# Altium schematic sheet MCU_IO.SchDoc: MCU - Peripheral and Pin Assignment
size A2; ApprovedBy: Weymen Koo; CheckedBy: -; DrawnBy: Weymen Koo; DocumentNumber: UBCAD-FCSOM-SCH; Revision: A; SheetNumber: 3; SheetTotal: 18; ProjectTitle: Flight Controller SoM; Status: PRELIMINARY; ReleaseDate: 2026-11-14
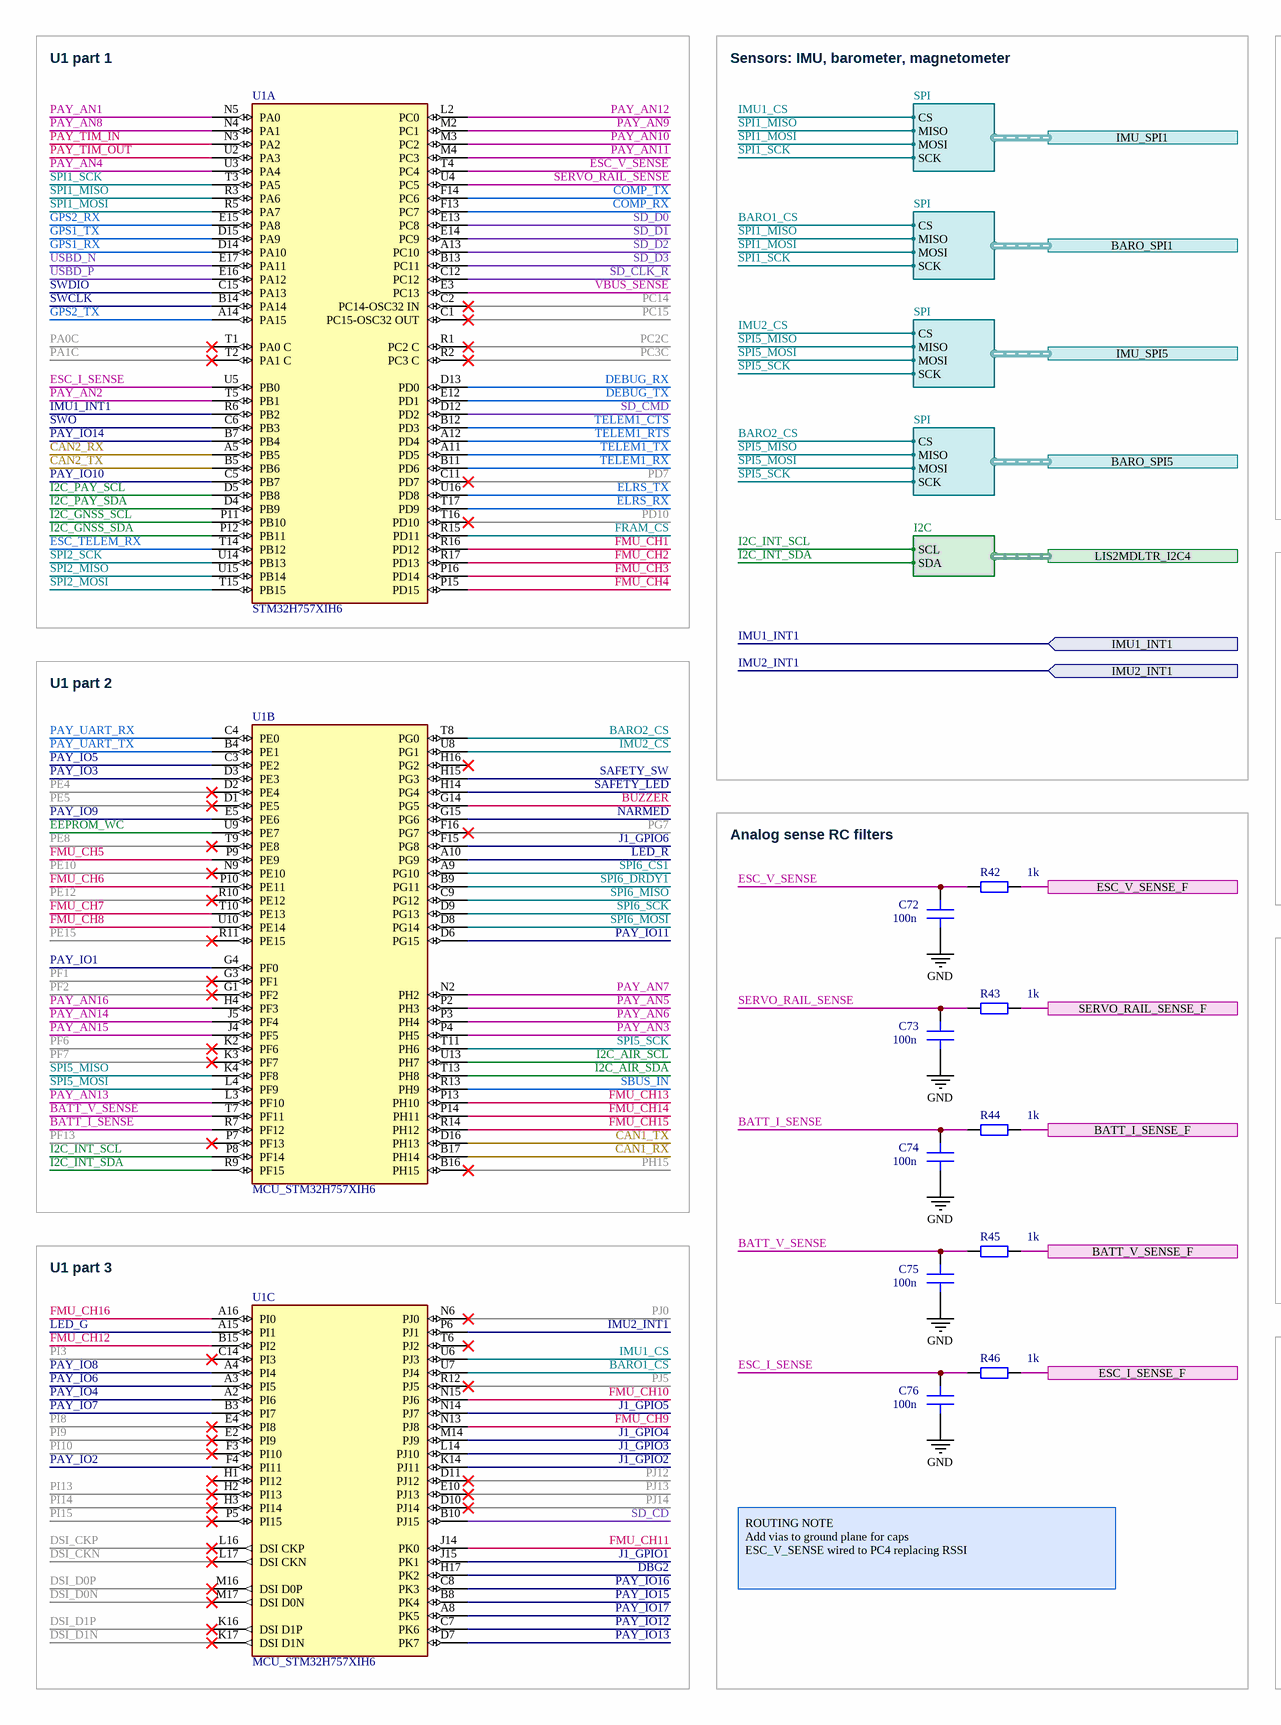
[diagram p0: MCU_IO.SchDoc, left]
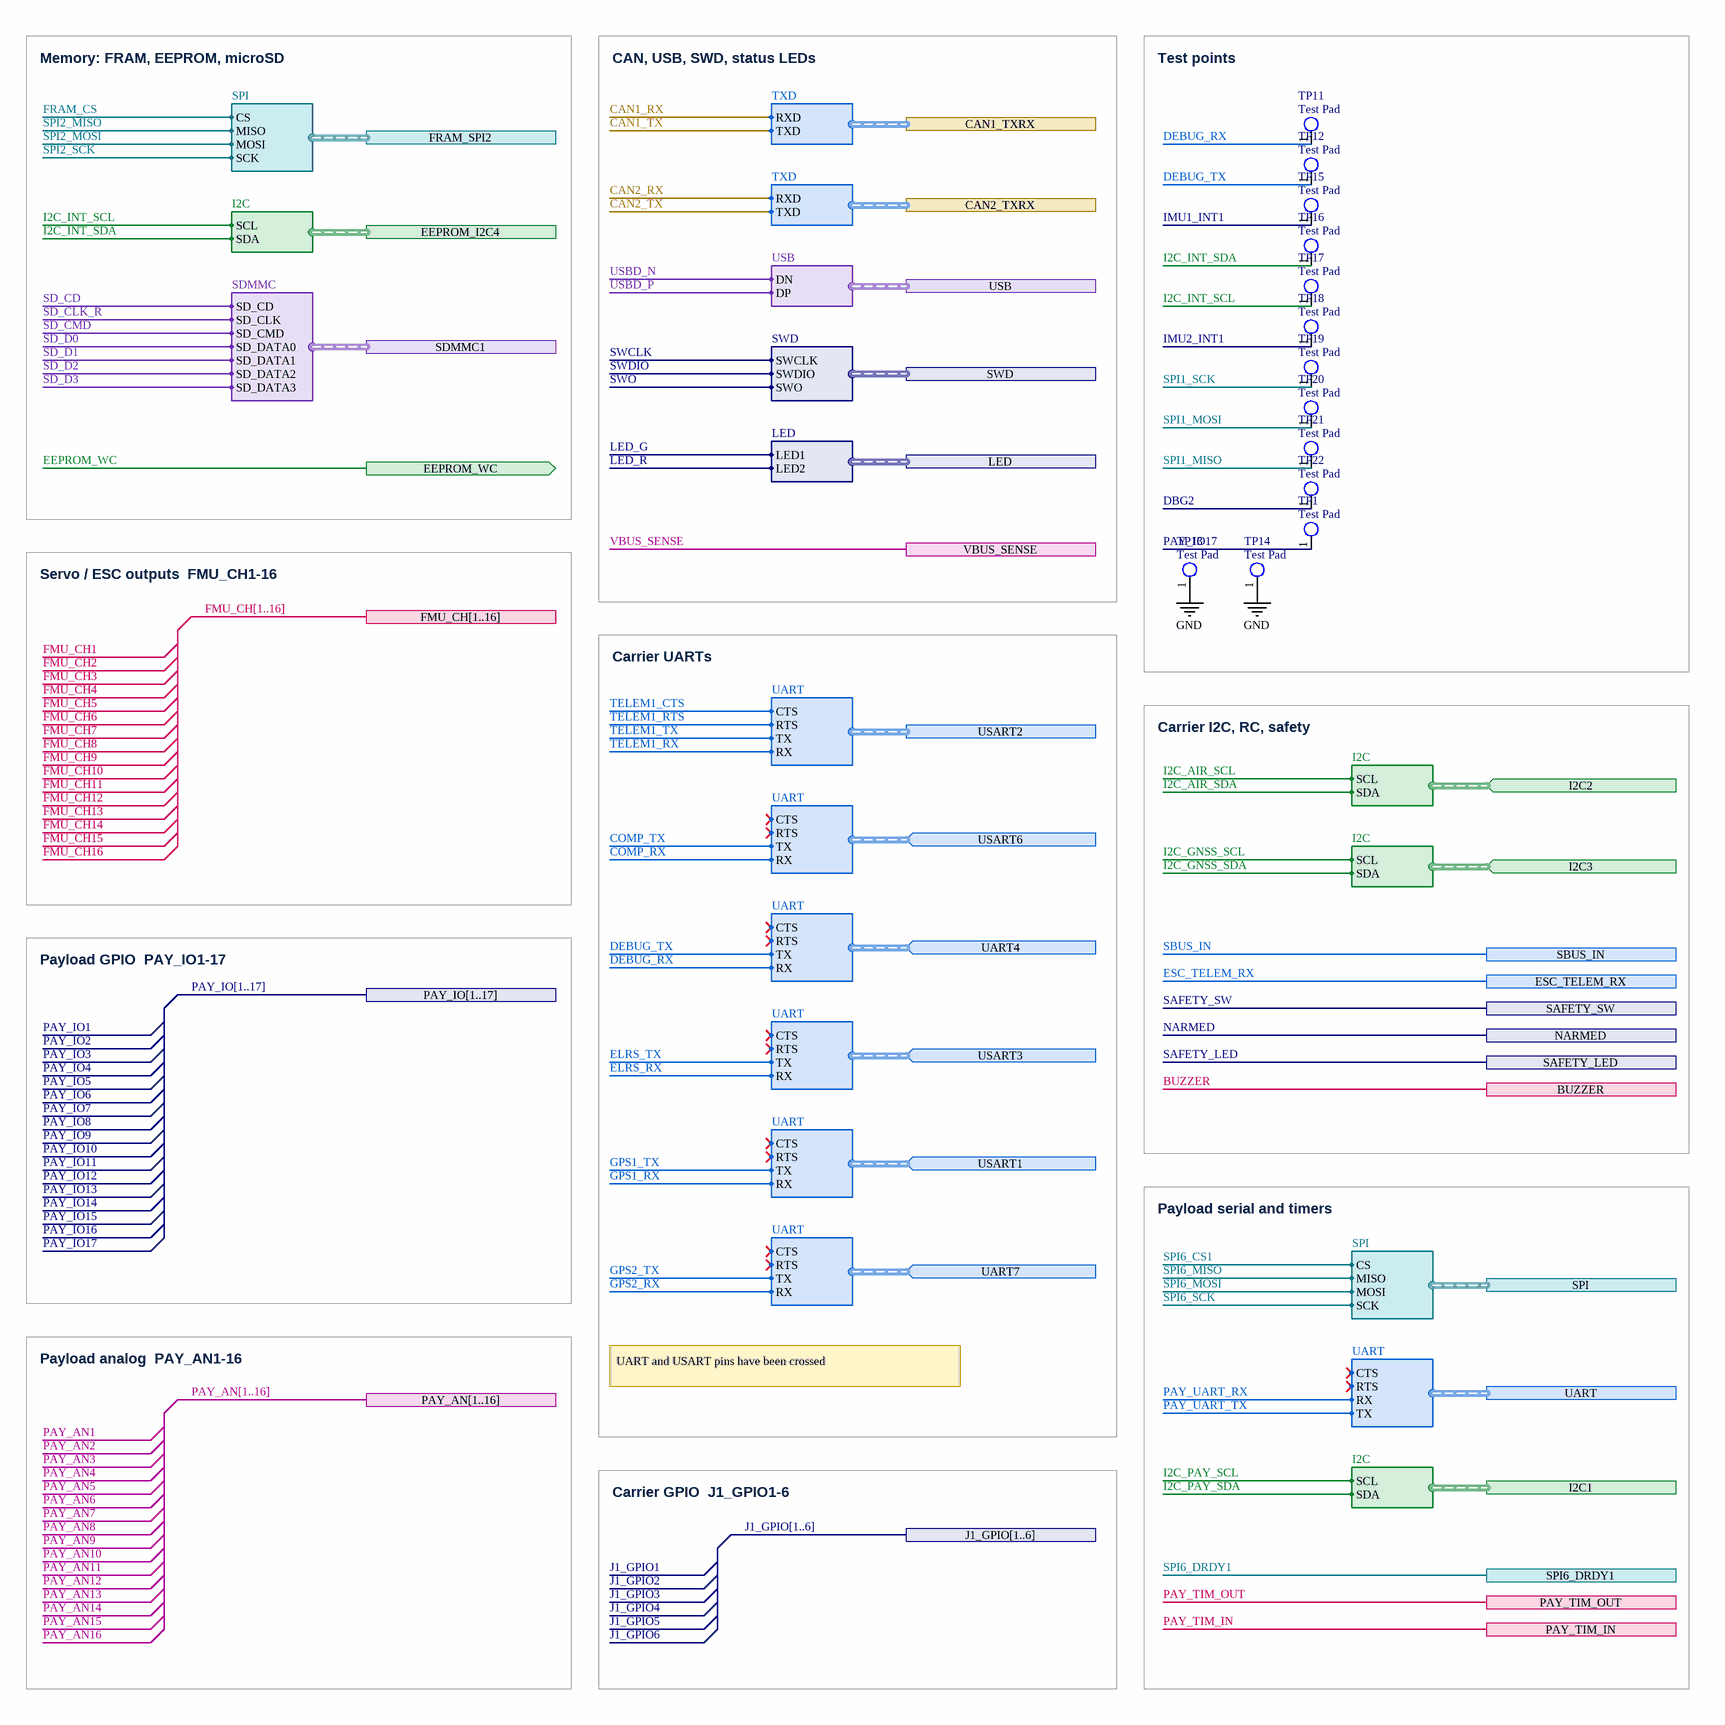
[diagram p1: MCU_IO.SchDoc, right]

## Parts
C72  100n  [IPC C C0402 NO SILK]
C73  100n  [IPC C C0402 NO SILK]
C74  100n  [IPC C C0402 NO SILK]
C75  100n  [IPC C C0402 NO SILK]
C76  100n  [IPC C C0402 NO SILK]
R42  1k  [IPC C R0402 NO SILK]
R43  1k  [IPC C R0402 NO SILK]
R44  1k  [IPC C R0402 NO SILK]
R45  1k  [IPC C R0402 NO SILK]
R46  1k  [IPC C R0402 NO SILK]
TP1  Test Pad  [PCBComponent_1]
TP11  Test Pad  [PCBComponent_1]
TP12  Test Pad  [PCBComponent_1]
TP13  Test Pad  [PCBComponent_1]
TP14  Test Pad  [PCBComponent_1]
TP15  Test Pad  [PCBComponent_1]
TP16  Test Pad  [PCBComponent_1]
TP17  Test Pad  [PCBComponent_1]
TP18  Test Pad  [PCBComponent_1]
TP19  Test Pad  [PCBComponent_1]
TP20  Test Pad  [PCBComponent_1]
TP21  Test Pad  [PCBComponent_1]
TP22  Test Pad  [PCBComponent_1]
U1  STM32H757XIH6  [FP-TFBGA2650-A07U-MFG]  (parts A,B,C of 5)

## Blocks framed on the sheet
U1 part 1: U1
Test points: TP1 TP11-TP22
U1 part 2: U1
Analog sense RC filters: C72-C76 R42-R46
U1 part 3: U1

## Ports
BARO_SPI1 (harness SPI, see 1[5B], 5[6B]), BARO_SPI5 (harness SPI, see 1[5B], 8[6B]), BATT_I_SENSE_F (see 1[4C], 18[2C]), BATT_V_SENSE_F (see 1[4C], 18[2C]), BUZZER (see 1[4D], 18[5A]), CAN1_TXRX (harness TXD, see 1[4C], 13[2B]), CAN2_TXRX (harness TXD, see 1[5A], 14[2B]), EEPROM_I2C4 (harness I2C, see 1[4B], 12[7B]), EEPROM_WC (out, see 1[4B], 12[2B]), ESC_I_SENSE_F (see 1[4C], 18[2C]), ESC_TELEM_RX (see 1[4D], 18[2D]), ESC_V_SENSE_F (see 1[4C], 18[2C]), FMU_CH[1..16] (see 1[4C], 18[5B]), FRAM_SPI2 (harness SPI, see 1[4B], 10[6C]), I2C1 (harness I2C, see 1[5C], 17[5C]), I2C2 (in, harness I2C, see 1[4C], 18[5D]), I2C3 (in, harness I2C, see 1[4C], 18[5C]), IMU1_INT1 (in, see 1[5A], 6[6B]), IMU2_INT1 (in, see 1[5B], 9[7C]), IMU_SPI1 (harness SPI, see 1[5A], 6[7B]), IMU_SPI5 (harness SPI, see 1[5B], 9[7B]), J1_GPIO[1..6] (see 1[4C], 18[5C]), LED (harness LED, see 1[5D], 15[5B]), LIS2MDLTR_I2C4 (harness I2C, see 1[5B], 7[6B]), NARMED (see 1[4D], 18[5A]), PAY_AN[1..16] (see 1[5C], 17[2C]), PAY_IO[1..17] (see 1[5C], 17[5A]), PAY_TIM_IN (see 1[5C], 17[5C]), PAY_TIM_OUT (see 1[5C], 17[5C]), SAFETY_LED (see 1[4D], 18[5A]), SAFETY_SW (see 1[4D], 18[5A]), SBUS_IN (see 1[4D], 18[2D]), SDMMC1 (harness SDMMC, see 1[4B], 11[7B]), SERVO_RAIL_SENSE_F (see 1[4D], 18[2C]), SPI6_DRDY1 (see 1[5C], 17[7C]), SPI (harness SPI, see 1[5C], 17[7B]), SWD (harness SWD, see 1[4A], 16[6C]), UART4 (in, harness UART, see 1[4C], 18[7B]), UART7 (in, harness UART, see 1[4C], 18[7B]), UART (harness UART, see 1[5C], 17[7A]), USART1 (in, harness UART, see 1[4C], 18[7B]), USART2 (harness UART, see 1[4C], 18[7C]), USART3 (in, harness UART, see 1[4C], 18[7A]), USART6 (in, harness UART, see 1[4C], 18[7A]), USB (harness USB, see 1[4A], 16[6B]), VBUS_SENSE (see 1[4B], 16[6A])

## Harnesses
TXD: RXD, TXD
SPI: CS, MISO, MOSI, SCK
SWD: SWCLK, SWDIO, SWO
USB: DN, DP
LED: LED1, LED2
SDMMC: SD_CD, SD_CLK, SD_CMD, SD_DATA0, SD_DATA1, SD_DATA2, SD_DATA3
I2C: SCL, SDA
UART: CTS, RTS, RX, TX
UART: CTS, RTS, TX, RX

## Nets
GND: C72.2 C73.2 C74.2 C75.2 C76.2 TP13.1 TP14.1
BARO1_CS: U1.U7(PJ4) ; port BARO_SPI1.CS
BARO2_CS: U1.T8(PG0) ; port BARO_SPI5.CS
BATT_I_SENSE: C74.1 R44.1 U1.R7(PF12)
BATT_I_SENSE_F: R44.2 ; port BATT_I_SENSE_F
BATT_V_SENSE: C75.1 R45.1 U1.T7(PF11)
BATT_V_SENSE_F: R45.2 ; port BATT_V_SENSE_F
BUZZER: U1.G14(PG5) ; port BUZZER
CAN1_RX: U1.B17(PH14) ; port CAN1_TXRX.RXD
CAN1_TX: U1.D16(PH13) ; port CAN1_TXRX.TXD
CAN2_RX: U1.A5(PB5) ; port CAN2_TXRX.RXD
CAN2_TX: U1.B5(PB6) ; port CAN2_TXRX.TXD
COMP_RX: U1.F13(PC7) ; port USART6.RX
COMP_TX: U1.F14(PC6) ; port USART6.TX
DBG2: TP22.1 U1.H17(PK2)
DEBUG_RX: TP11.1 U1.D13(PD0) ; port UART4.RX
DEBUG_TX: TP12.1 U1.E12(PD1) ; port UART4.TX
DSI_CKN: U1.L17(DSI_CKN)
DSI_CKP: U1.L16(DSI_CKP)
DSI_D0N: U1.M17(DSI_D0N)
DSI_D0P: U1.M16(DSI_D0P)
DSI_D1N: U1.K17(DSI_D1N)
DSI_D1P: U1.K16(DSI_D1P)
EEPROM_WC: U1.U9(PE7) ; port EEPROM_WC
ELRS_RX: U1.T17(PD9) ; port USART3.RX
ELRS_TX: U1.U16(PD8) ; port USART3.TX
ESC_I_SENSE: C76.1 R46.1 U1.U5(PB0)
ESC_I_SENSE_F: R46.2 ; port ESC_I_SENSE_F
ESC_TELEM_RX: U1.T14(PB12) ; port ESC_TELEM_RX
ESC_V_SENSE: C72.1 R42.1 U1.T4(PC4)
ESC_V_SENSE_F: R42.2 ; port ESC_V_SENSE_F
FMU_CH1: U1.R16(PD12)
FMU_CH2: U1.R17(PD13)
FMU_CH3: U1.P16(PD14)
FMU_CH4: U1.P15(PD15)
FMU_CH5: U1.P9(PE9)
FMU_CH6: U1.P10(PE11)
FMU_CH7: U1.T10(PE13)
FMU_CH8: U1.U10(PE14)
FMU_CH9: U1.N13(PJ8)
FMU_CH10: U1.N15(PJ6)
FMU_CH11: U1.J14(PK0)
FMU_CH12: U1.B15(PI2)
FMU_CH13: U1.P13(PH10)
FMU_CH14: U1.P14(PH11)
FMU_CH15: U1.R14(PH12)
FMU_CH16: U1.A16(PI0)
FRAM_CS: U1.R15(PD11) ; port FRAM_SPI2.CS
GPS1_RX: U1.D14(PA10) ; port USART1.RX
GPS1_TX: U1.D15(PA9) ; port USART1.TX
GPS2_RX: U1.E15(PA8) ; port UART7.RX
GPS2_TX: U1.A14(PA15) ; port UART7.TX
I2C_AIR_SCL: U1.U13(PH7) ; port I2C2.SCL
I2C_AIR_SDA: U1.T13(PH8) ; port I2C2.SDA
I2C_GNSS_SCL: U1.P11(PB10) ; port I2C3.SCL
I2C_GNSS_SDA: U1.P12(PB11) ; port I2C3.SDA
I2C_INT_SCL: TP17.1 U1.P8(PF14) ; port EEPROM_I2C4.SCL, port LIS2MDLTR_I2C4.SCL
I2C_INT_SDA: TP16.1 U1.R9(PF15) ; port EEPROM_I2C4.SDA, port LIS2MDLTR_I2C4.SDA
I2C_PAY_SCL: U1.D5(PB8) ; port I2C1.SCL
I2C_PAY_SDA: U1.D4(PB9) ; port I2C1.SDA
IMU1_CS: U1.U6(PJ3) ; port IMU_SPI1.CS
IMU1_INT1: TP15.1 U1.R6(PB2) ; port IMU1_INT1
IMU2_CS: U1.U8(PG1) ; port IMU_SPI5.CS
IMU2_INT1: TP18.1 U1.P6(PJ1) ; port IMU2_INT1
J1_GPIO1: U1.J15(PK1)
J1_GPIO2: U1.K14(PJ11)
J1_GPIO3: U1.L14(PJ10)
J1_GPIO4: U1.M14(PJ9)
J1_GPIO5: U1.N14(PJ7)
J1_GPIO6: U1.F15(PG8)
LED_G: U1.A15(PI1) ; port LED.LED1
LED_R: U1.A10(PG9) ; port LED.LED2
NARMED: U1.G15(PG6) ; port NARMED
PA0C: U1.T1(PA0_C)
PA1C: U1.T2(PA1_C)
PAY_AN1: U1.N5(PA0)
PAY_AN2: U1.T5(PB1)
PAY_AN3: U1.P4(PH5)
PAY_AN4: U1.U3(PA4)
PAY_AN5: U1.P2(PH3)
PAY_AN6: U1.P3(PH4)
PAY_AN7: U1.N2(PH2)
PAY_AN8: U1.N4(PA1)
PAY_AN9: U1.M2(PC1)
PAY_AN10: U1.M3(PC2)
PAY_AN11: U1.M4(PC3)
PAY_AN12: U1.L2(PC0)
PAY_AN13: U1.L3(PF10)
PAY_AN14: U1.J5(PF4)
PAY_AN15: U1.J4(PF5)
PAY_AN16: U1.H4(PF3)
PAY_IO1: U1.G4(PF0)
PAY_IO2: U1.F4(PI11)
PAY_IO3: U1.D3(PE3)
PAY_IO4: U1.A2(PI6)
PAY_IO5: U1.C3(PE2)
PAY_IO6: U1.A3(PI5)
PAY_IO7: U1.B3(PI7)
PAY_IO8: U1.A4(PI4)
PAY_IO9: U1.E5(PE6)
PAY_IO10: U1.C5(PB7)
PAY_IO11: U1.D6(PG15)
PAY_IO12: U1.C7(PK6)
PAY_IO13: U1.D7(PK7)
PAY_IO14: U1.B7(PB4)
PAY_IO15: U1.B8(PK4)
PAY_IO16: U1.C8(PK3)
PAY_IO17: TP1.1 U1.A8(PK5)
PAY_TIM_IN: U1.N3(PA2) ; port PAY_TIM_IN
PAY_TIM_OUT: U1.U2(PA3) ; port PAY_TIM_OUT
PAY_UART_RX: U1.C4(PE0) ; port UART.RX
PAY_UART_TX: U1.B4(PE1) ; port UART.TX
PC2C: U1.R1(PC2_C)
PC3C: U1.R2(PC3_C)
PC14: U1.C2(PC14-OSC32_IN)
PC15: U1.C1(PC15-OSC32_OUT)
PD7: U1.C11(PD7)
PD10: U1.T16(PD10)
PE4: U1.D2(PE4)
PE5: U1.D1(PE5)
PE8: U1.T9(PE8)
PE10: U1.N9(PE10)
PE12: U1.R10(PE12)
PE15: U1.R11(PE15)
PF1: U1.G3(PF1)
PF2: U1.G1(PF2)
PF6: U1.K2(PF6)
PF7: U1.K3(PF7)
PF13: U1.P7(PF13)
PG7: U1.F16(PG7)
PH15: U1.B16(PH15)
PI3: U1.C14(PI3)
PI8: U1.E4(PI8)
PI9: U1.E2(PI9)
PI10: U1.F3(PI10)
PI13: U1.H2(PI13)
PI14: U1.H3(PI14)
PI15: U1.P5(PI15)
PJ0: U1.N6(PJ0)
PJ5: U1.R12(PJ5)
PJ12: U1.D11(PJ12)
PJ13: U1.E10(PJ13)
PJ14: U1.D10(PJ14)
SAFETY_LED: U1.H14(PG4) ; port SAFETY_LED
SAFETY_SW: U1.H15(PG3) ; port SAFETY_SW
SBUS_IN: U1.R13(PH9) ; port SBUS_IN
SD_CD: U1.B10(PJ15) ; port SDMMC1.SD_CD
SD_CLK_R: U1.C12(PC12) ; port SDMMC1.SD_CLK
SD_CMD: U1.D12(PD2) ; port SDMMC1.SD_CMD
SD_D0: U1.E13(PC8) ; port SDMMC1.SD_DATA0
SD_D1: U1.E14(PC9) ; port SDMMC1.SD_DATA1
SD_D2: U1.A13(PC10) ; port SDMMC1.SD_DATA2
SD_D3: U1.B13(PC11) ; port SDMMC1.SD_DATA3
SERVO_RAIL_SENSE: C73.1 R43.1 U1.U4(PC5)
SERVO_RAIL_SENSE_F: R43.2 ; port SERVO_RAIL_SENSE_F
SPI1_MISO: TP21.1 U1.R3(PA6) ; port IMU_SPI1.MISO, port BARO_SPI1.MISO
SPI1_MOSI: TP20.1 U1.R5(PA7) ; port IMU_SPI1.MOSI, port BARO_SPI1.MOSI
SPI1_SCK: TP19.1 U1.T3(PA5) ; port IMU_SPI1.SCK, port BARO_SPI1.SCK
SPI2_MISO: U1.U15(PB14) ; port FRAM_SPI2.MISO
SPI2_MOSI: U1.T15(PB15) ; port FRAM_SPI2.MOSI
SPI2_SCK: U1.U14(PB13) ; port FRAM_SPI2.SCK
SPI5_MISO: U1.K4(PF8) ; port IMU_SPI5.MISO, port BARO_SPI5.MISO
SPI5_MOSI: U1.L4(PF9) ; port IMU_SPI5.MOSI, port BARO_SPI5.MOSI
SPI5_SCK: U1.T11(PH6) ; port IMU_SPI5.SCK, port BARO_SPI5.SCK
SPI6_CS1: U1.A9(PG10) ; port SPI.CS
SPI6_DRDY1: U1.B9(PG11) ; port SPI6_DRDY1
SPI6_MISO: U1.C9(PG12) ; port SPI.MISO
SPI6_MOSI: U1.D8(PG14) ; port SPI.MOSI
SPI6_SCK: U1.D9(PG13) ; port SPI.SCK
SWCLK: U1.B14(PA14) ; port SWD.SWCLK
SWDIO: U1.C15(PA13) ; port SWD.SWDIO
SWO: U1.C6(PB3) ; port SWD.SWO
TELEM1_CTS: U1.B12(PD3) ; port USART2.CTS
TELEM1_RTS: U1.A12(PD4) ; port USART2.RTS
TELEM1_RX: U1.B11(PD6) ; port USART2.RX
TELEM1_TX: U1.A11(PD5) ; port USART2.TX
USBD_N: U1.E17(PA11) ; port USB.DN
USBD_P: U1.E16(PA12) ; port USB.DP
VBUS_SENSE: U1.E3(PC13) ; port VBUS_SENSE

Not connected (* = marked no-connect by the designer): U1 H1(PI12)* H16(PG2)* T6(PJ2)*

## Buses and harness runs
bus FMU_CH[1..16] = port FMU_CH[1..16]
bus J1_GPIO[1..6] = port J1_GPIO[1..6]
bus PAY_AN[1..16] = port PAY_AN[1..16]
bus PAY_IO[1..17] = port PAY_IO[1..17]

## Notes on the sheet
- Sensors: IMU, barometer, magnetometer
- Memory: FRAM, EEPROM, microSD
- CAN, USB, SWD, status LEDs
- Servo / ESC outputs  FMU_CH1-16
- Carrier UARTs
- Carrier I2C, RC, safety
- Payload GPIO  PAY_IO1-17
- Payload serial and timers
- Payload analog  PAY_AN1-16
- UART and USART pins have been crossed
- Carrier GPIO  J1_GPIO1-6
- ROUTING NOTE
  Add vias to ground plane for caps
  ESC_V_SENSE wired to PC4 replacing RSSI
- PROJECT
- KEY
- POWER
- 5 V class
- 3.3 V class
- Core / SMPS
- GND
- SHEET TITLE
- SIGNALS
- NOTES
- SPI
- Analog
- Design
- I2C
- PWM/Timer
- Layout
- UART/RC
- GPIO/Ctrl
- Assembly
- CAN
- Unused pin
- Firmware
- USB/SD/Clk
- Critical
- DRAWN
- DOCUMENT NO.
- CHECKED
- REV
- STATUS
- APPROVED
- DATE
- FILE
- SIZE
- A2
- SHEET
- of

## Library data of the parts
C72-C76 = CMP-002-000000-4: CAP 100n 16V X7R 10% 0402; Manufacturer: Samsung; Manufacturer Part Number: CL05B104KO5NNNC; Value: 100n; Source: Schlib1.SchLib; Design Item ID: Generic CAP 0402; Package: 0402; Tolerance: 10%; Voltage: 16V; Dielectric: X7R; LCSC Part #: C1525
R42-R46 = CMP-008-000000-2: RES 1k 1% 1/16W 0402; Manufacturer: UNI-ROYAL; Manufacturer Part Number: 0402WGF1001TCE; Value: 1k; Source: Schlib1.SchLib; Design Item ID: Generic RES 0402; Package: 0402; Tolerance: 1%; Power: 1/16W; LCSC Part #: C11702
TP1 TP11-TP22 = CMP-092-000000-4: Design Item ID: TP; Source: Testpoint.SchLib
U1 = CMP-029-000010-1: MCU 32-bit ARM Cortex M7/M4 RISC 2MB Flash 3.3V 265-Pin TFBGA Tray; Component Type: Standard; Design Item ID: MCU_STM32H757XIH6; Pin Count: 265; Source: CRLS Lib.SchLib